# Altium schematic sheet Sheet1.SchDoc
size A; SheetNumber: 1; SheetTotal: 10
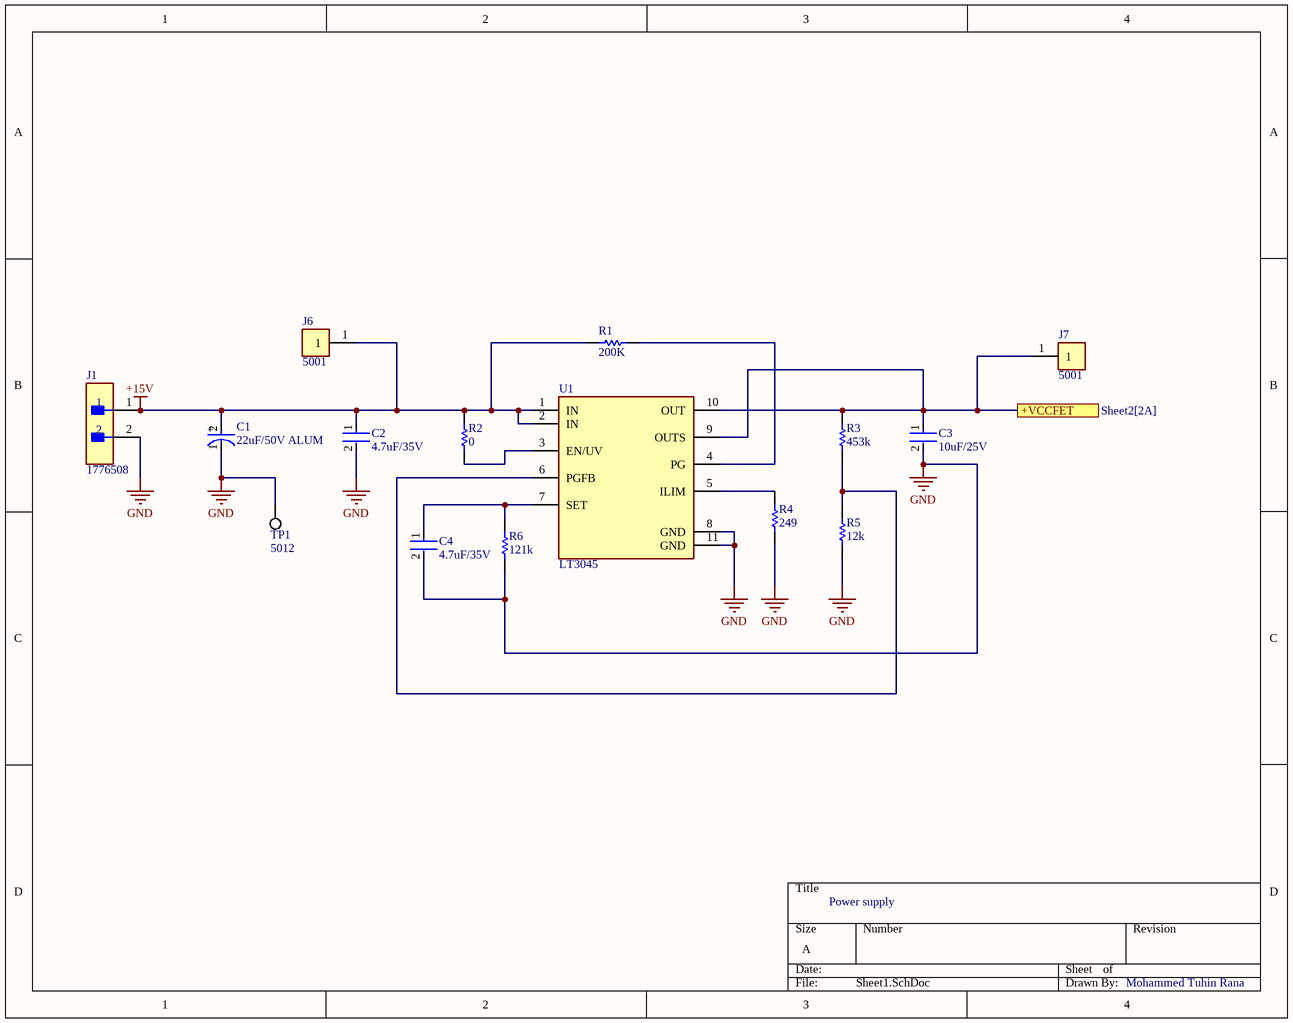
[diagram p0: Sheet1.SchDoc]

## Parts
C1  22uF/50V ALUM  [FP-FKD-MFG]
C2  4.7uF/35V  [FP-C3216-160-0_2-IPC_C]
C3  10uF/25V  [FP-GRM31C-0_2-e0_3_0_8-MFG]
C4  4.7uF/35V  [FP-C3216-160-0_2-IPC_C]
J1  1776508  [FP-1776508-MFG]
J6  5001  [FP-5001-MFG]
J7  5001  [FP-5001-MFG]
R1  200K  [RESC1005X40X25NL05T05]
R2  0  [RESC2013X70X40NL20T20]
R3  453k  [RESC2013X70X40LL20T20]
R4  249  [RESC2013X70X40NL20T20]
R5  12k  [RESC1005X40X25ML05T05]
R6  121k  [RESC1608X55X30LL15T15]
TP1  5012  [KSTN-5012_V]
U1  LT3045  [FP-LT3045EDD#PBF-MFG]

## Ports
+VCCFET (see Sheet2[2A])

## Nets
+15V: C1.2(A) C2.1 J1.1 J6.1 R1.2 R2.2 U1.1(IN) U1.2(IN)
GND: C1.1(C) C2.2 C3.2 C4.2 J1.2 R4.1 R5.1 R6.1 TP1.1 U1.8(GND) U1.11(GND)
+VCCFET: C3.1 J7.1 R3.2 U1.9(OUTS) U1.10(OUT) ; port +VCCFET
NetC4_1: C4.1 R6.2 U1.7(SET)
NetR1_1: R1.1 U1.4(PG)
NetR2_1: R2.1 U1.3(EN/UV)
NetR3_1: R3.1 R5.2 U1.6(PGFB)
NetR4_2: R4.2 U1.5(ILIM)

## Notes on the sheet
- Power supply
- Mohammed Tuhin Rana
- (in symbol CMP-2000-06209-2) +

## Library data of the parts
C1 = CMP-2000-06209-2: CAP ALUM 22UF 20% 50V SMD; Life (Hours): 2000Hour; Ripple Current: 165mA; ESR (Equivalent Series Resistance): 880mR; Dielectric Material: Aluminium; Leakage Current: 3uA; Polarity: Polar; Radiation Hardening: No; Lead Free: Lead Free; Capacitance: 22uF; Package Quantity: 1000; Width: 7.8mm; Length: 5.8mm; Max Operating Temperature: 105°C; Tolerance: 20%; Height - Seated (Max): 0.24inch; Height: 5.8mm; Voltage Rating: 50V; Diameter: 6.3mm; Series: FK; Voltage: 50V; Termination: SMD/SMT; Construction: Cylindrical; Mount: Surface Mount; Number of Pins: 2; Case/Package: Radial; Packaging: Tape and Reel; Ripple Current (AC): 165mA; REACH SVHC: No SVHC; Min Operating Temperature: -55°C; Contact Plating: Tin; Voltage Rating (DC): 50V; RoHS Compliant: Yes; Impedance: 880mR
C2 C4 = CMP-08246-003663-1: Multilayer Ceramic Capacitors 4.7uF ±10% 35V X7R SMD 1206; Width: 0.063inch; Depth: 1.6mm; Case Code (Metric): 3216; Dielectric: X7R; Case/Package: 1206; Voltage Rating: 35V; Tolerance: 10%; Series: C; Height: 1.6mm; Dielectric Material: Ceramic; Packaging: Tape and Reel; Capacitance: 4.7uF; RoHS Compliant: Yes; Min Operating Temperature: -55°C; Termination: SMD/SMT; Mount: Surface Mount; Voltage Rating (DC): 35V; Package Quantity: 1; Max Operating Temperature: 125°C; Case Code (Imperial): 1206; Length: 3.2mm; Construction: Flat; Lead Free: Lead Free; Thickness: 0.075inch; Weight: 0.000571oz
C3 = CMP-06035-003589-1: Chip Multilayer Ceramic Capacitors for General Purpose, 1206, 10uF, X7R, 15%, 10%, 25V; Case Code (Imperial): 1206; Voltage Rating (DC): 25V; Voltage Rating: 25V; Length: 3.2mm; Lead Free: Lead Free; Thickness: 0.071inch; Package Quantity: 1; Width: 1.6mm; Max Operating Temperature: 125°C; Number of Pins: 2; Height: 1.6mm; Case Code (Metric): 3216; REACH SVHC: No SVHC; Radiation Hardening: No; Case/Package: 1206; Material: Ceramic; Tolerance: 10%; Voltage: 25V; Mount: Surface Mount; Packaging: Tape and Reel; Dielectric: X7R; Termination: SMD/SMT; Min Operating Temperature: -55°C; Capacitance: 10uF; Depth: 1.6mm
J1 = CMP-09399-000017-1: TERM BLOCK HDR 2POS 90DEG 5.08MM; Connector Type: Plug; Number of Positions: 2; Voltage: 300V; Number of Levels: 1; Max Current Rating: 12A; Voltage Rating: 250V; Approvals: CSA; Pitch: 5.08mm; Package Quantity: 50; Contact Material: Tin; Orientation: Right Angle; Packaging: Bulk; Height: 12.1mm; Lead Free: Lead Free; Contact Plating: Tin; Mount: Through Hole; Series: MSTB; Current: 12A; Housing Material: Polybutylene; Color: Green; RoHS Compliant: Yes; Number of Poles: 2; Length: 20.32mm; Weight: 5.396916oz; Number of Rows: 1; Flammability Rating: UL94 V-0; Housing Color: Green; Width: 20.32mm; Current Rating: 12A; Termination: Solder; Number of Positions Per Level: 2; Depth: 12mm; Number of Contacts: 2
J6 J7 = CMP-2000-05181-2: PC TEST POINT MINIATURE BLACK; Body Material: Bronze; Plating: Silver; Inside Diameter: 1.27mm; Hole Diameter: 1.6mm; Number of Ports: 1; Outside Diameter: 2.54mm; Insulation: Insulated; Insulation Material: Nylon; Mount: Through Hole; RoHS Compliant: Yes; Series: THM; Height: 0.3inch; Termination: Through Hole; Material: Nylon; Packaging: Bulk; Contact Material: Bronze; REACH SVHC: No SVHC; Contact Plating: Silver; Orientation: Straight; Lead Free: Lead Free; Package Quantity: 100; Length: 7.62mm; Flammability Rating: UL94 V-0; Number of Contacts: 1; Diameter: 2.54mm; Housing Color: Black; Color: Black
R1 = CMP-1011-00768-4: Chip Resistor, 200 KOhm, +/- 1%, 100 mW, -55 to 155 degC, 0402 (1005 Metric), RoHS, Tape and Reel; PartNumber: ERJ-2RKF2003X; Manufacturer: Basic Passives; Case\/Package: 0402; Voltage Rating: 50 V; Power Rating: 100 mW; RoHSCompliant: true; Length: 1 mm; DatasheetVersion: 04/2015; ComponentLink2URL: http://industrial.panasonic.com/cdbs/www-data/pdf/RDA0000/AOA0000C86.pdf; Mount: Surface Mount; PackageDescription: 2-Pin Surface Mount Device, Body 1 x 0.5 mm; Tolerance: 1%; Width: 0.5 mm; ComponentLink2Description: Datasheet; Packaging: Tape and Reel; REACH SVHC: No SVHC; Min Operating Temperature: -55 degC; Package Quantity: 10000; ComponentLink1Description: Manufacturer URL; Height: 0.35 mm; ComponentLink1URL: http://www.panasonic.com/; Mounting Technology: Surface Mount; Case Code (Imperial): 0402; PackageReference: 0402; Radiation Hardening: No; Pins: 2; Max Operating Temperature: 155 degC; Resistance: 200 KOhm; Case Code (Metric): 1005
R2 = CMP-1665-00002-5: Chip Resistor, 0 Ohm, +/- 1%, 0.125 W, -55 to 155 degC, 0805 (2012 Metric), RoHS, Tape and Reel; PartNumber: ERJ-6GEY0R00V; Tolerance: 5%; Resistance: 0 Ohm; REACH SVHC: No SVHC; Min Operating Temperature: -55 degC; Case/Package: 0805; Packaging: Tape and Reel; Package Quantity: 5000; ComponentLink1Description: Manufacturer URL; PackageDescription: 2-Pin Surface Mount Device, Body 2 x 1.25 mm; Mounting Technology: Surface Mount; Max Operating Temperature: 155 degC; Width: 1.25 mm; RoHSCompliant: True; Height: 0.6 mm; ComponentLink1URL: http://www.panasonic.com/; ComponentLink2URL: http://industrial.panasonic.com/cdbs/www-data/pdf/RDA0000/AOA0000C84.pdf; Case Code (Imperial): 0805; DatasheetVersion: 03/2015; Length: 2 mm; Case Code (Metric): 2012; ComponentLink2Description: Datasheet; Radiation Hardening: No
R3 = CMP-2001-00194-1: Manufacturer: Panasonic; Part Number: ERJ-6ENF4533V
R4 = CMP-2001-00071-1: Part Number: ERJ-6ENF2490V; Manufacturer: Panasonic
R5 = CMP-2002-00646-4: Chip Resistor, 12 KOhm, +/- 1%, 0.1 W, -55 to 155 degC, 0402 (1005 Metric), RoHS, Tape and Reel; PartNumber: ERJ-2RKF1202X; Resistance: 12 KOhm; Voltage Rating: 50 V; Case\/Package: 0402; Power Rating: 100 mW; Length: 1 mm; PackageReference: 0402; DatasheetVersion: 04/2015; ComponentLink2Description: Datasheet; ComponentLink1URL: http://www.panasonic.com/; Pins: 2; Width: 0.5 mm; REACH SVHC: Yes; Packaging: Tape and Reel; Min Operating Temperature: -55 degC; Mounting Technology: Surface Mount; Max Operating Temperature: 155 degC; Case Code (Imperial): 0402; Height: 0.35 mm; Tolerance: 1%; PackageDescription: 2-Pin Surface Mount Device, Body 1 x 0.5 mm; RoHSCompliant: true; ComponentLink1Description: Manufacturer URL; Mount: Surface Mount; ComponentLink2URL: http://industrial.panasonic.com/cdbs/www-data/pdf/RDA0000/AOA0000C86.pdf; Package Quantity: 10000; Case Code (Metric): 1005
R6 = CMP-2000-00221-1: Manufacturer: Panasonic; Part Number: ERJ-3EKF1213V
TP1 = CMP-1672-00004-4: Test Point, White, Through Hole, RoHS, Bulk; Manufacturer: Keystone; DatasheetVersion: Rev. F, 12/2013; ComponentLink1URL: http://www.keyelco.com/; PackageReference: 5012; RoHSCompliant: true; ComponentLink2Description: Datasheet; Colour: White; Contact Material: Bronze; PackageDescription: 1-Pin Through Hole Device, Dia 3.17 mm; Mounting Technology: Through Hole; Mount: Through Hole; Package Quantity: 100; ComponentLink1Description: Manufacturer URL; Pins: 1; Height: 8.12 mm; Packaging: Bulk; REACH SVHC: No SVHC; Contact Plating: Silver; Length: 11.3 mm; ComponentLink2URL: http://www.keyelco.com/product-pdf.cfm?p=1321
U1 = CMP-09138-000240-1: IC REG LINEAR 0V 500MA 10DFN; Min Current Limit: 570mA; Number of Regulators: 1; Dropout Voltage: 260mV; Output Voltage: 15V; RoHS Compliant: Yes; Series: -; Output Current: 500mA; Case/Package: DFN; Max Operating Temperature: 125°C; Min Operating Temperature: -40°C